# Altium schematic sheet SM619GEFDFST.SchDoc
size A1; Organization: Protel International P/L; DocumentNumber: 2; SheetNumber: 2; SheetTotal: 10; PageSetup: Record=PageOptions|CenterHorizontal=True|CenterVertical=True|PrintScale=0.70|XCorrection=1.00|YCorrection=1.00|PrintKind=2|BorderSize=5000000|LeftOffset=0|BottomOffset=0|Orientation=2|PaperLength=1000|PaperWidth=1000|Scale=100|PaperSource=7|PrintQuality=600|MediaType=1|DitherType=10|PaperKind=A4|PrintScaleMode=1; Razrabotal: Балобанов; Proveril: Шартдинов; NachKb: Рекалов; Nkontr: Завалина; Utv: Беккель; DecNum: ЦВИЯ.467239.035 Э3; Naim1: УУ; Naim2: Схема электрическая; Naim3: принципиальная; List: 1; Listov: 1; DecNum2: ЦВИЯ.467239.035 Э3
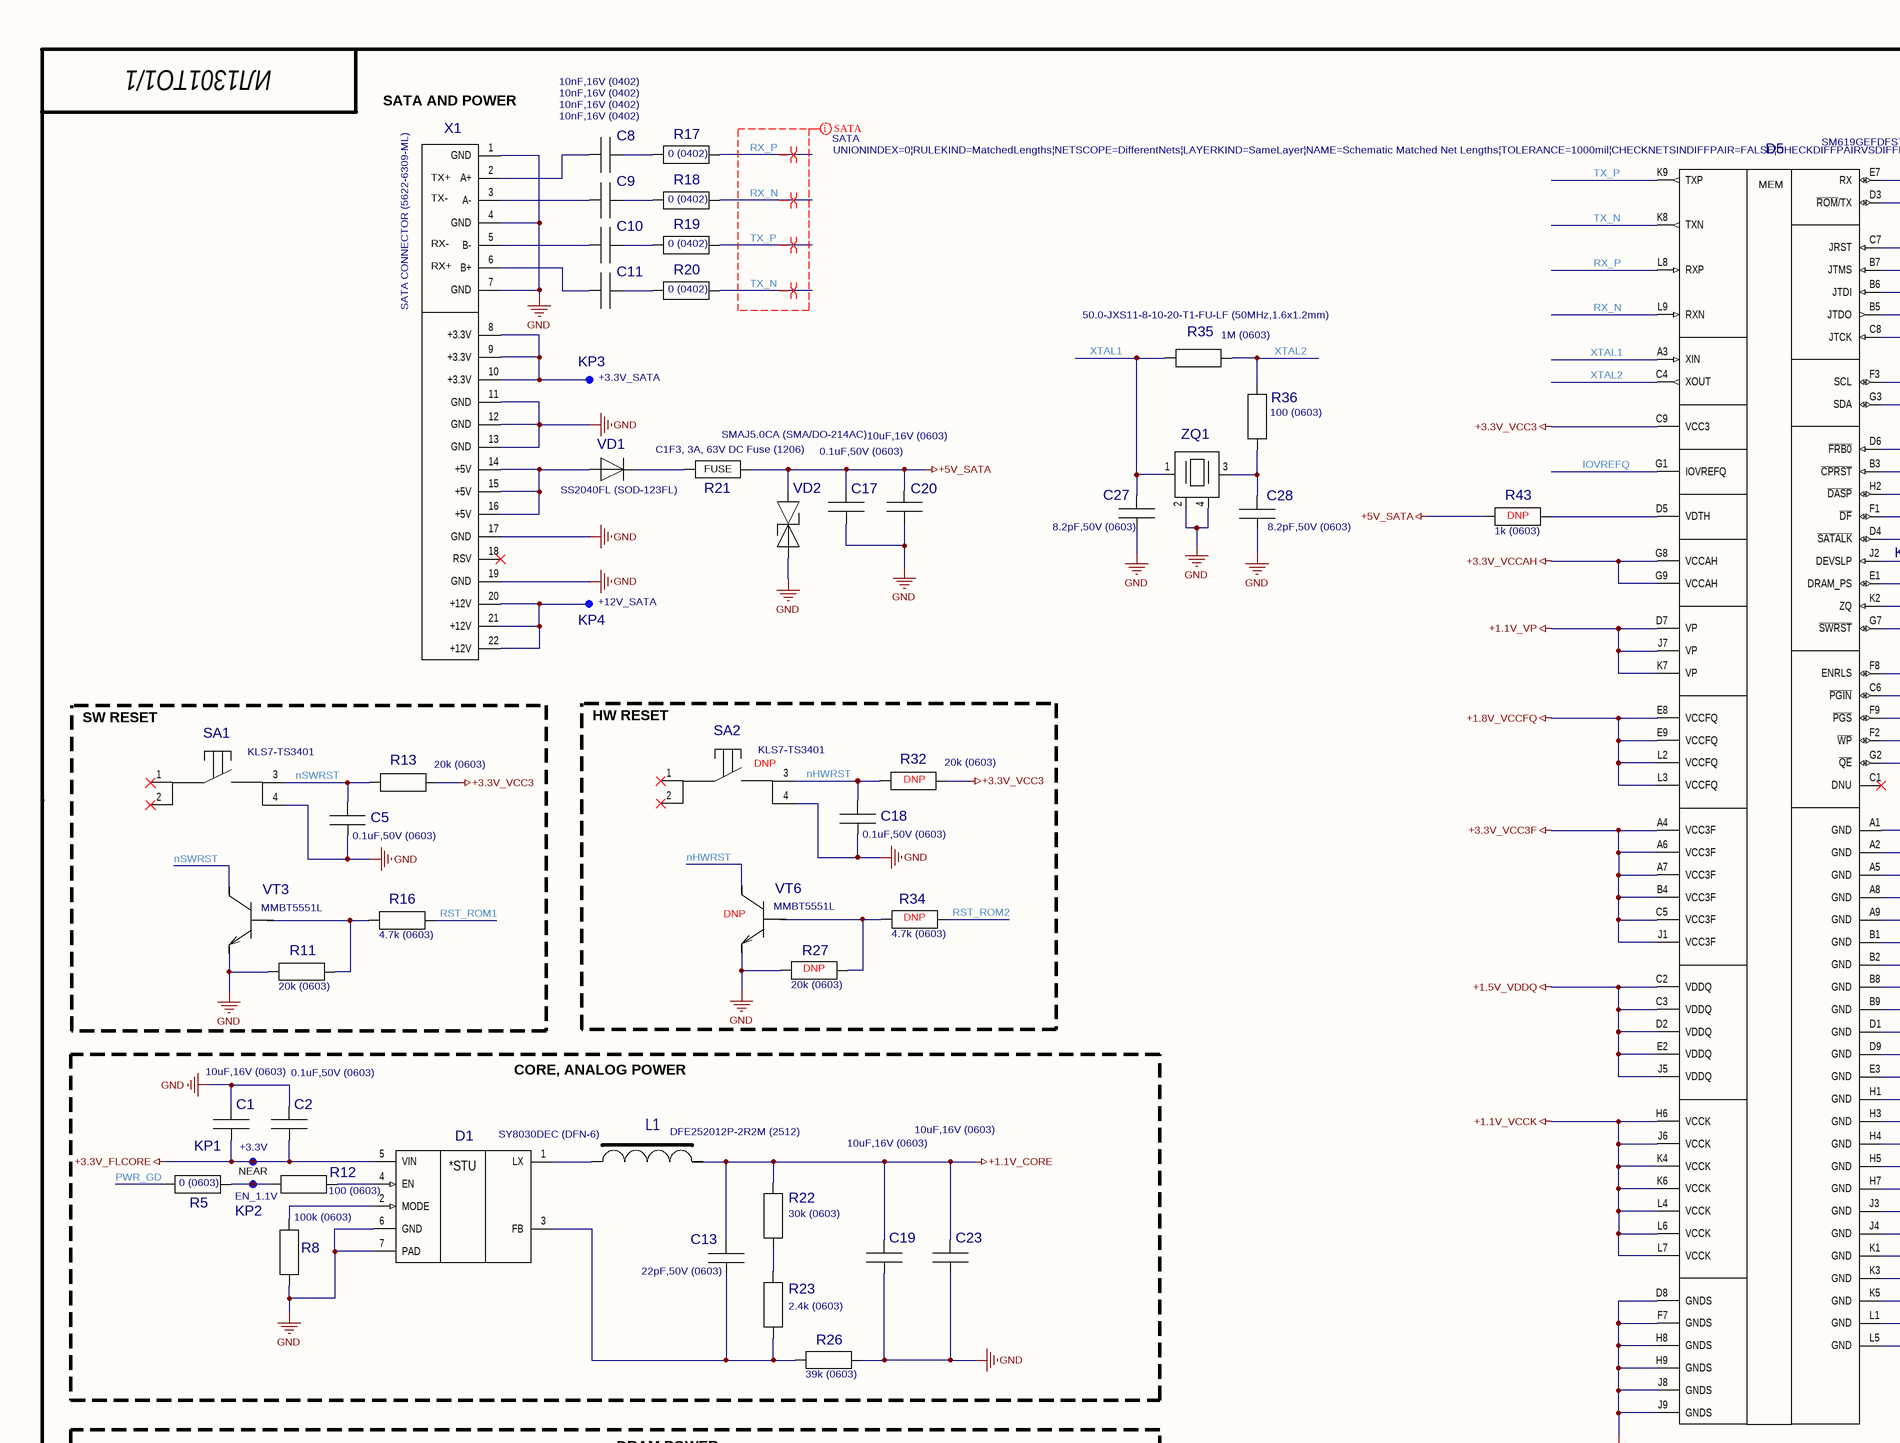
[diagram p0: SM619GEFDFST.SchDoc, top left]
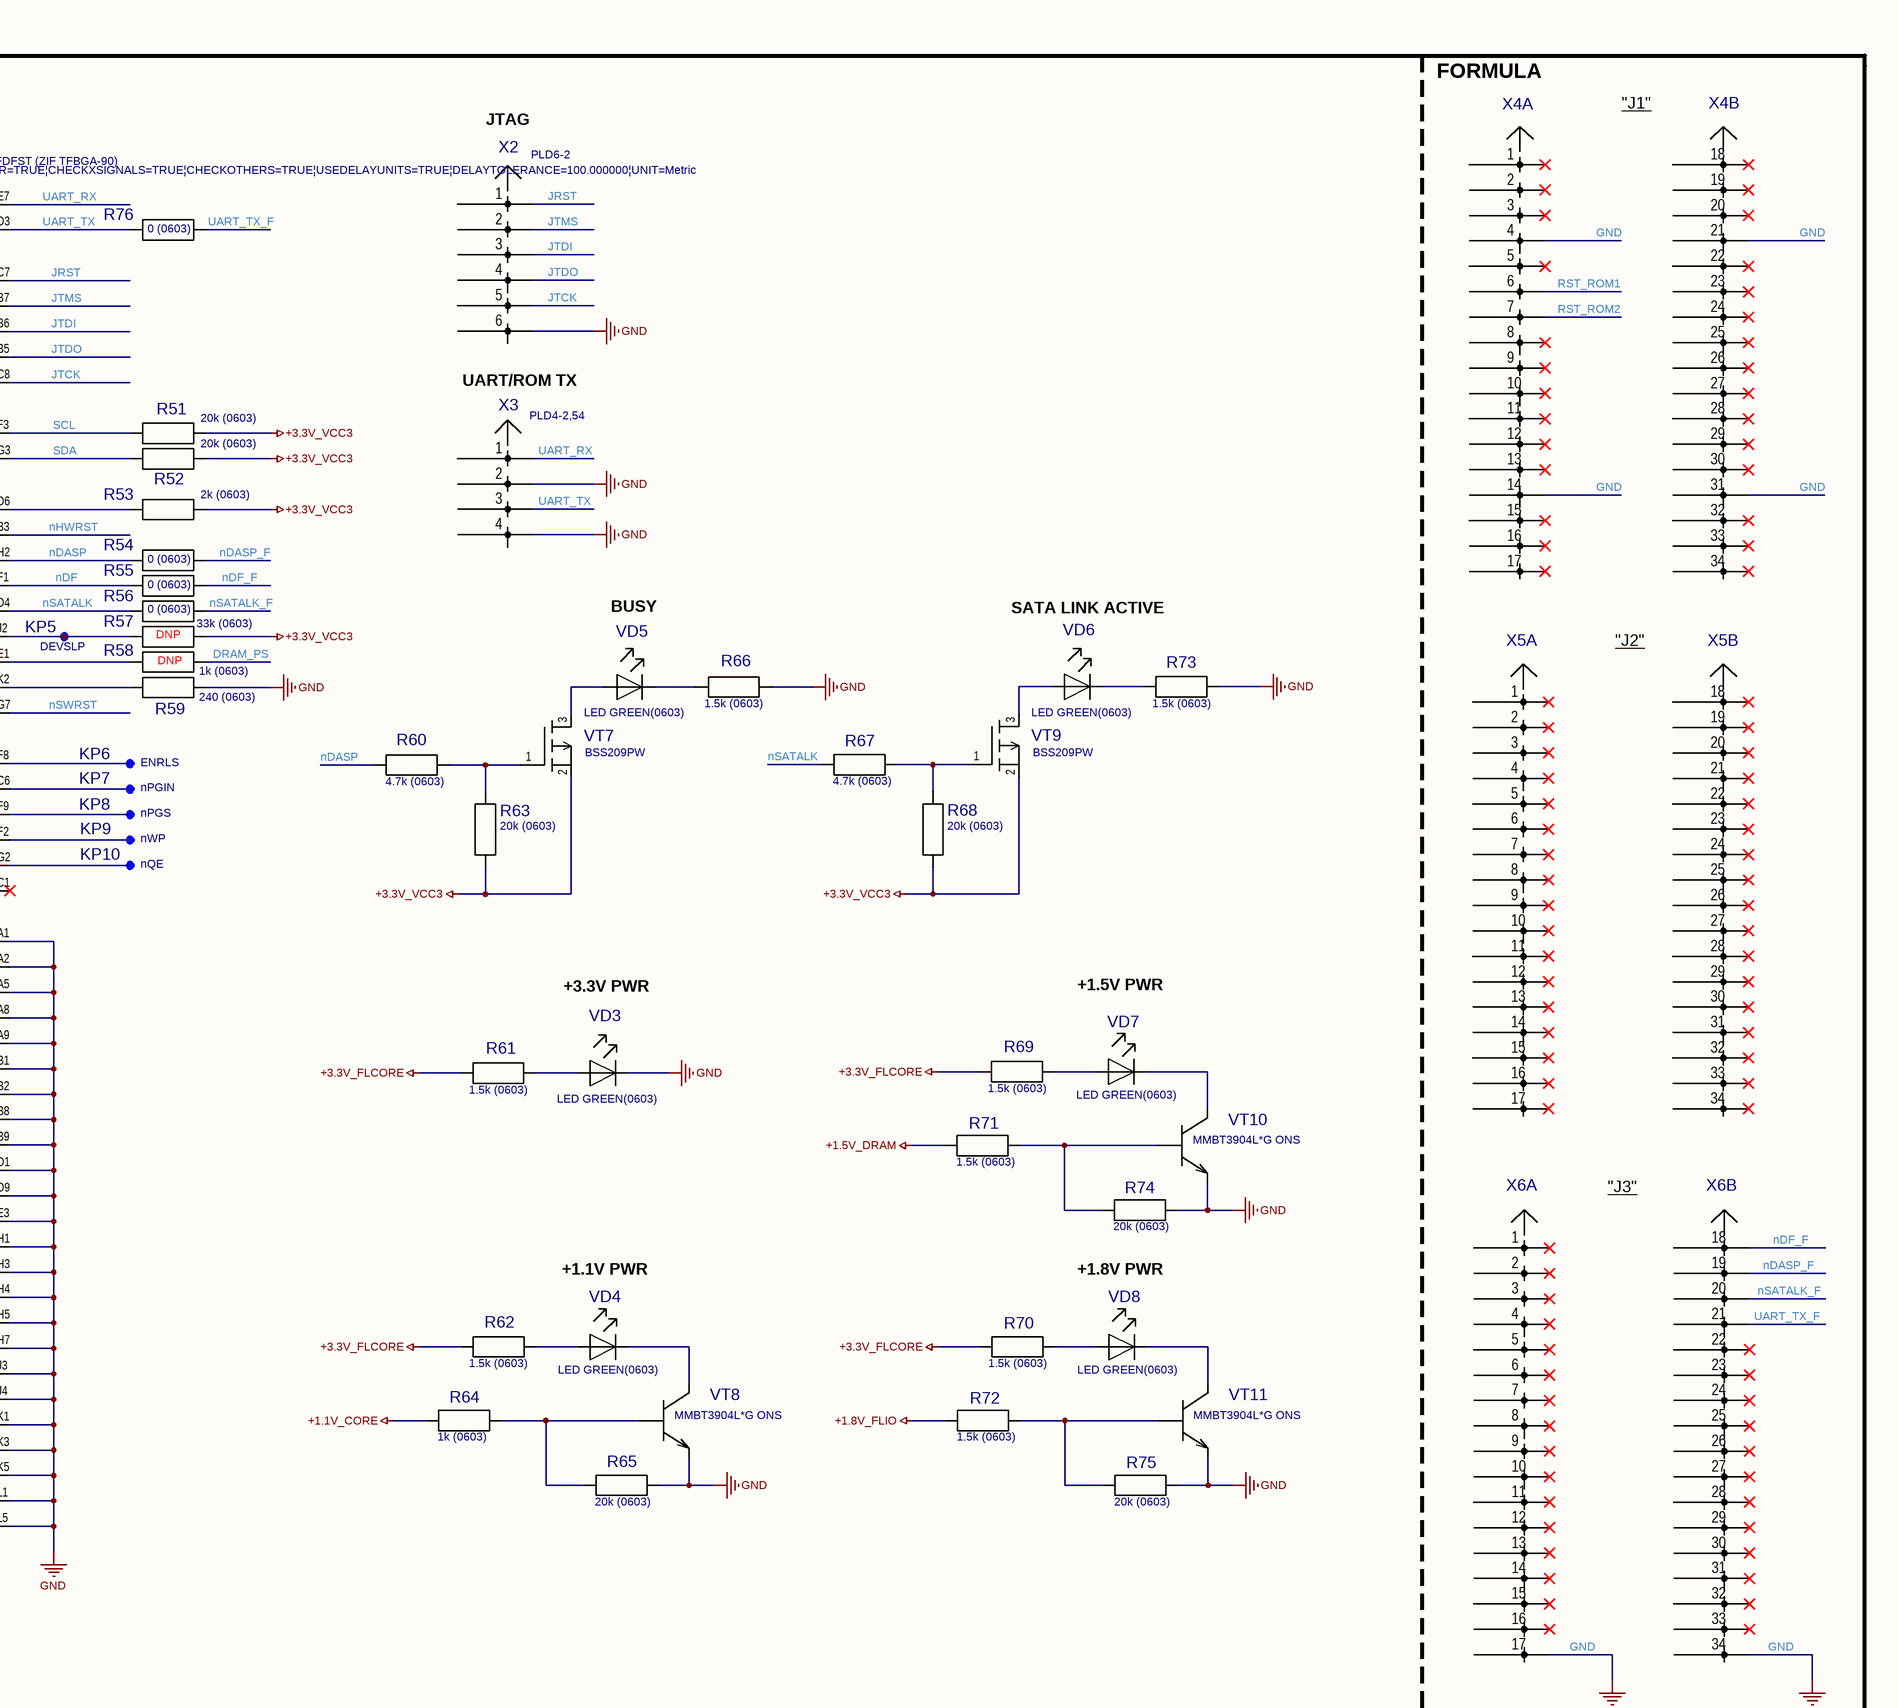
[diagram p1: SM619GEFDFST.SchDoc, top right]
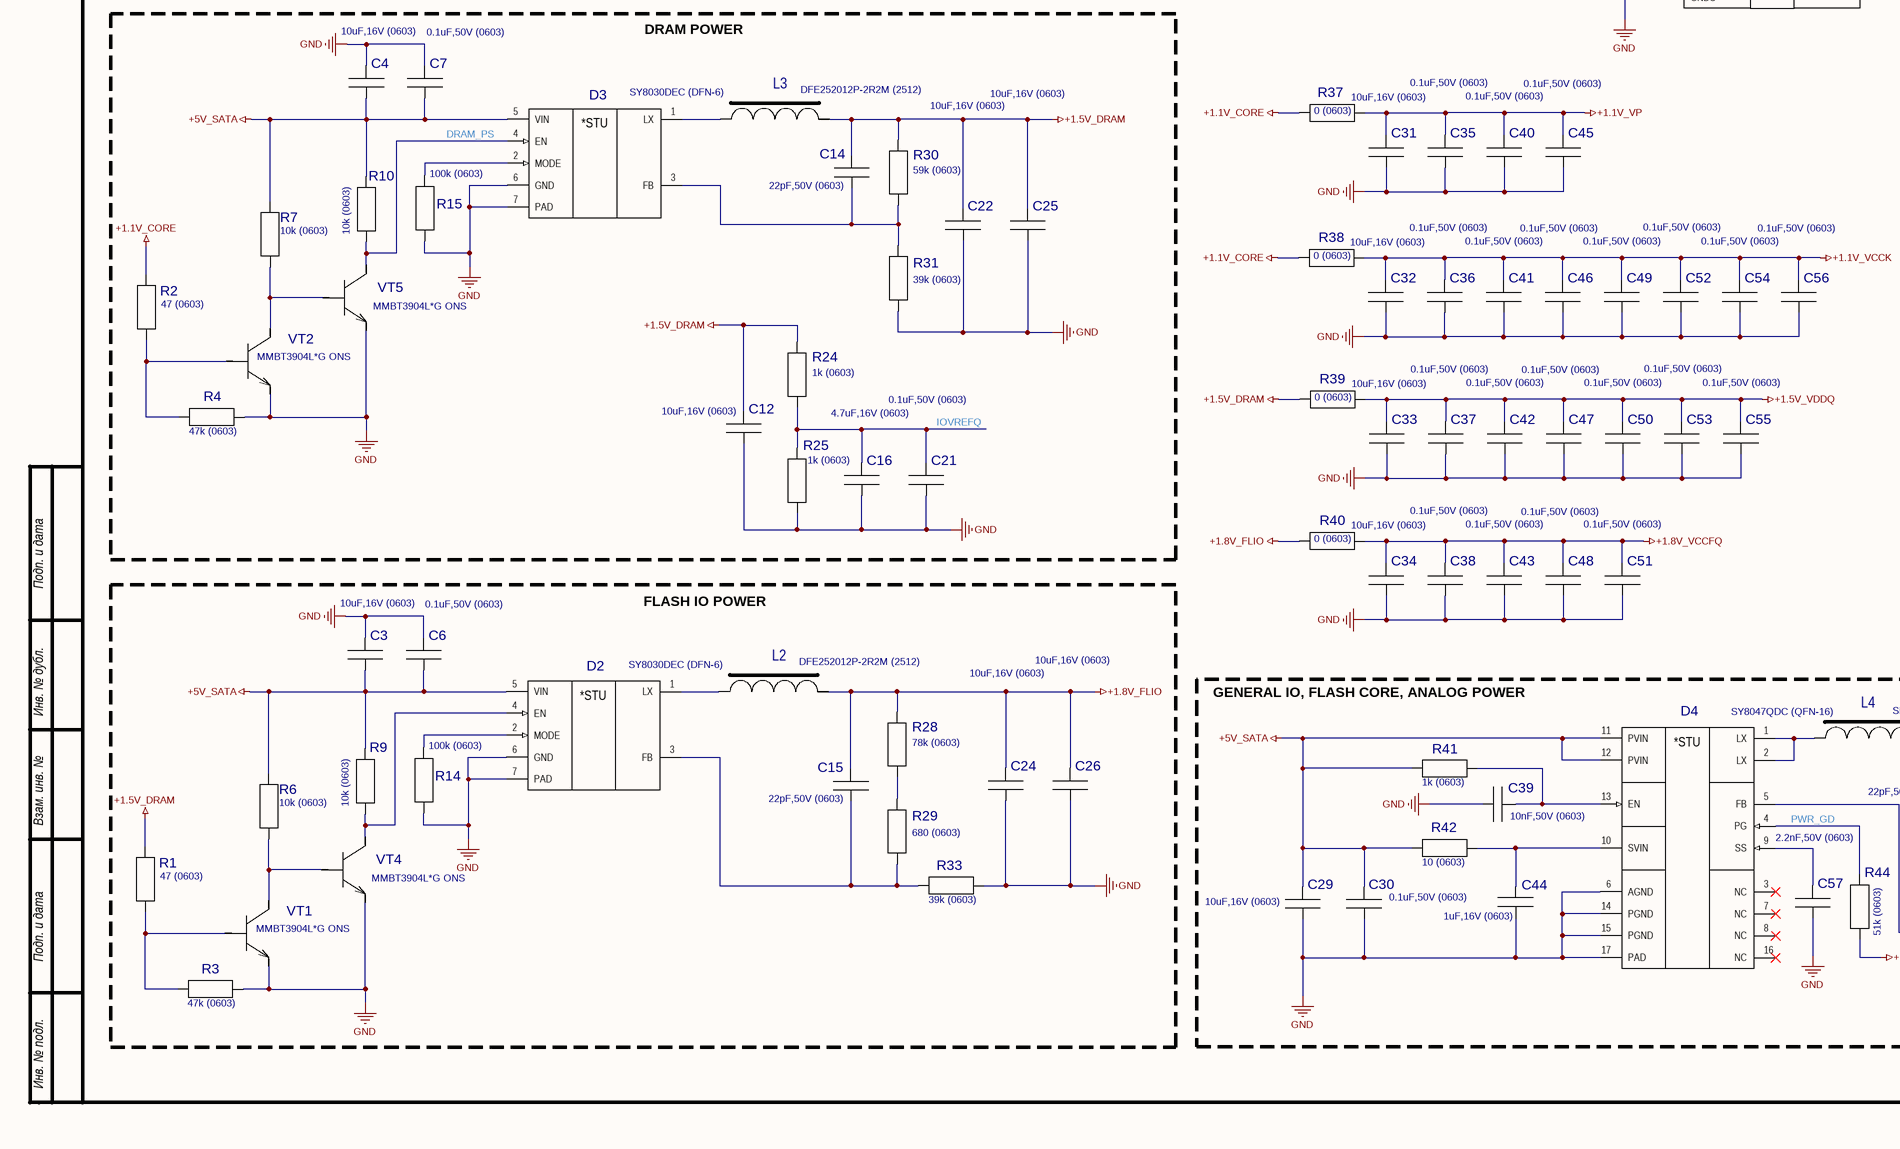
[diagram p2: SM619GEFDFST.SchDoc, bottom left]
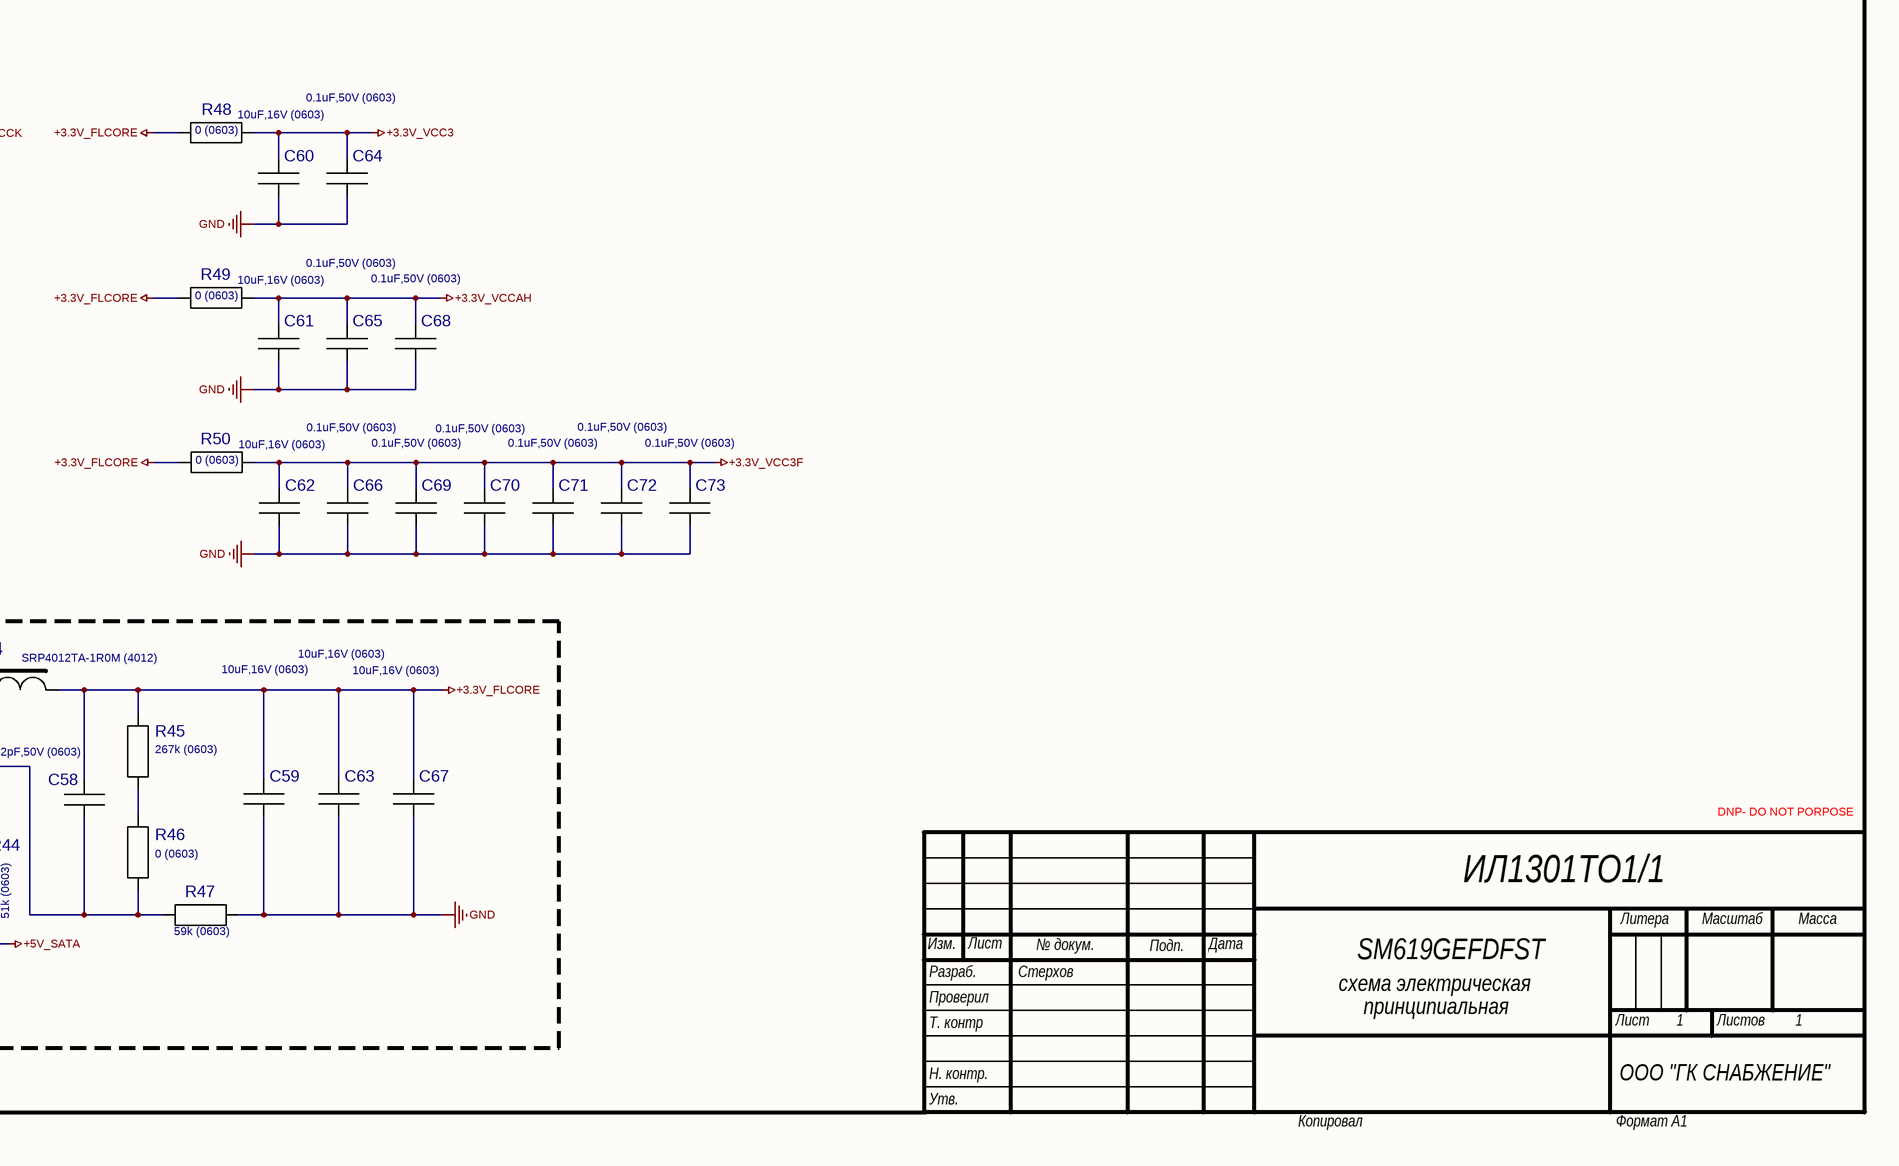
[diagram p3: SM619GEFDFST.SchDoc, bottom right]

## Parts
C1  10uF,16V (0603)  [0603]
C2  0.1uF,50V (0603)  [0603]
C3  10uF,16V (0603)  [0603]
C4  10uF,16V (0603)  [0603]
C5  0.1uF,50V (0603)  [0603]
C6  0.1uF,50V (0603)  [0603]
C7  0.1uF,50V (0603)  [0603]
C8  10nF,16V (0402)  [0402]
C9  10nF,16V (0402)  [0402]
C10  10nF,16V (0402)  [0402]
C11  10nF,16V (0402)  [0402]
C12  10uF,16V (0603)  [0603]
C13  22pF,50V (0603)  [0603]
C14  22pF,50V (0603)  [0603]
C15  22pF,50V (0603)  [0603]
C16  4.7uF,16V (0603)  [0603]
C17  0.1uF,50V (0603)  [0603]
C18  0.1uF,50V (0603)  [0603]
C19  10uF,16V (0603)  [0603]
C20  10uF,16V (0603)  [0603]
C21  0.1uF,50V (0603)  [0603]
C22  10uF,16V (0603)  [0603]
C23  10uF,16V (0603)  [0603]
C24  10uF,16V (0603)  [0603]
C25  10uF,16V (0603)  [0603]
C26  10uF,16V (0603)  [0603]
C27  8.2pF,50V (0603)  [0603]
C28  8.2pF,50V (0603)  [0603]
C29  10uF,16V (0603)  [0603]
C30  0.1uF,50V (0603)  [0603]
C31  10uF,16V (0603)  [0603]
C32  10uF,16V (0603)  [0603]
C33  10uF,16V (0603)  [0603]
C34  10uF,16V (0603)  [0603]
C35  0.1uF,50V (0603)  [0603]
C36  0.1uF,50V (0603)  [0603]
C37  0.1uF,50V (0603)  [0603]
C38  0.1uF,50V (0603)  [0603]
C39  10nF,50V (0603)  [0603]
C40  0.1uF,50V (0603)  [0603]
C41  0.1uF,50V (0603)  [0603]
C42  0.1uF,50V (0603)  [0603]
C43  0.1uF,50V (0603)  [0603]
C44  1uF,16V (0603)  [0603]
C45  0.1uF,50V (0603)  [0603]
C46  0.1uF,50V (0603)  [0603]
C47  0.1uF,50V (0603)  [0603]
C48  0.1uF,50V (0603)  [0603]
C49  0.1uF,50V (0603)  [0603]
C50  0.1uF,50V (0603)  [0603]
C51  0.1uF,50V (0603)  [0603]
C52  0.1uF,50V (0603)  [0603]
C53  0.1uF,50V (0603)  [0603]
C54  0.1uF,50V (0603)  [0603]
C55  0.1uF,50V (0603)  [0603]
C56  0.1uF,50V (0603)  [0603]
C57  2.2nF,50V (0603)  [0603]
C58  22pF,50V (0603)  [0603]
C59  10uF,16V (0603)  [0603]
C60  10uF,16V (0603)  [0603]
C61  10uF,16V (0603)  [0603]
C62  10uF,16V (0603)  [0603]
C63  10uF,16V (0603)  [0603]
C64  0.1uF,50V (0603)  [0603]
C65  0.1uF,50V (0603)  [0603]
C66  0.1uF,50V (0603)  [0603]
C67  10uF,16V (0603)  [0603]
C68  0.1uF,50V (0603)  [0603]
C69  0.1uF,50V (0603)  [0603]
C70  0.1uF,50V (0603)  [0603]
C71  0.1uF,50V (0603)  [0603]
C72  0.1uF,50V (0603)  [0603]
C73  0.1uF,50V (0603)  [0603]
D1  SY8030DEC (DFN-6)  [DFN-6(2x2)]
D2  SY8030DEC (DFN-6)  [DFN-6(2x2)]
D3  SY8030DEC (DFN-6)  [DFN-6(2x2)]
D4  SY8047QDC (QFN-16)  [QFN-16]
D5  SM619GEFDFST (ZIF TFBGA-90)  [ASS3145-BGA90-16X20-1-1.67-ZS]
KP1  +3.3V  [Plosh15X06]
KP2  EN_1.1V  [Plosh15X06]
KP3  +3.3V_SATA  [Plosh15X06]
KP4  +12V_SATA  [Plosh15X06]
KP5  DEVSLP  [Plosh15X06]
KP6  ENRLS  [Plosh15X06]
KP7  nPGIN  [Plosh15X06]
KP8  nPGS  [Plosh15X06]
KP9  nWP  [Plosh15X06]
KP10  nQE  [Plosh15X06]
L1  DFE252012P-2R2M (2512)  [DFE252012P-2R2M (2512)]
L2  DFE252012P-2R2M (2512)  [DFE252012P-2R2M (2512)]
L3  DFE252012P-2R2M (2512)  [DFE252012P-2R2M (2512)]
L4  SRP4012TA-1R0M (4012)  [SRP4012TA-1R0M (4012)]
R1  47 (0603)  [0603]
R2  47 (0603)  [0603]
R3  47k (0603)  [0603]
R4  47k (0603)  [0603]
R5  0 (0603)  [0603]
R6  10k (0603)  [0603]
R7  10k (0603)  [0603]
R8  100k (0603)  [0603]
R9  10k (0603)  [0603]
R10  10k (0603)  [0603]
R11  20k (0603)  [0603]
R12  100 (0603)  [0603]
R13  20k (0603)  [0603]
R14  100k (0603)  [0603]
R15  100k (0603)  [0603]
R16  4.7k (0603)  [0603]
R17  0 (0402)  [0402]
R18  0 (0402)  [0402]
R19  0 (0402)  [0402]
R20  0 (0402)  [0402]
R21  C1F3, 3A, 63V DC Fuse (1206)  [1206]
R22  30k (0603)  [0603]
R23  2.4k (0603)  [0603]
R24  1k (0603)  [0603]
R25  1k (0603)  [0603]
R26  39k (0603)  [0603]
R27  20k (0603)  [0603]
R28  78k (0603)  [0603]
R29  680 (0603)  [0603]
R30  59k (0603)  [0603]
R31  39k (0603)  [0603]
R32  20k (0603)  [0603]
R33  39k (0603)  [0603]
R34  4.7k (0603)  [0603]
R35  1M (0603)  [0603]
R36  100 (0603)  [0603]
R37  0 (0603)  [0603]
R38  0 (0603)  [0603]
R39  0 (0603)  [0603]
R40  0 (0603)  [0603]
R41  1k (0603)  [0603]
R42  10 (0603)  [0603]
R43  1k (0603)  [0603]
R44  51k (0603)  [0603]
R45  267k (0603)  [0603]
R46  0 (0603)  [0603]
R47  59k (0603)  [0603]
R48  0 (0603)  [0603]
R49  0 (0603)  [0603]
R50  0 (0603)  [0603]
R51  20k (0603)  [0603]
R52  20k (0603)  [0603]
R53  2k (0603)  [0603]
R54  0 (0603)  [0603]
R55  0 (0603)  [0603]
R56  0 (0603)  [0603]
R57  33k (0603)  [0603]
R58  1k (0603)  [0603]
R59  240 (0603)  [0603]
R60  4.7k (0603)  [0603]
R61  1.5k (0603)  [0603]
R62  1.5k (0603)  [0603]
R63  20k (0603)  [0603]
R64  1k (0603)  [0603]
R65  20k (0603)  [0603]
R66  1.5k (0603)  [0603]
R67  4.7k (0603)  [0603]
R68  20k (0603)  [0603]
R69  1.5k (0603)  [0603]
R70  1.5k (0603)  [0603]
R71  1.5k (0603)  [0603]
R72  1.5k (0603)  [0603]
R73  1.5k (0603)  [0603]
R74  20k (0603)  [0603]
R75  20k (0603)  [0603]
R76  0 (0603)  [0603]
SA1  KLS7-TS3401  [KLS7-TS3401]
SA2  KLS7-TS3401  [KLS7-TS3401]
VD1  SS2040FL (SOD-123FL)  [SOD-123]
VD2  SMAJ5.0CA (SMA/DO-214AC)  [SMA(DO-214AC)]
VD3  LED GREEN(0603)  [0603(LED)]
VD4  LED GREEN(0603)  [0603(LED)]
VD5  LED GREEN(0603)  [0603(LED)]
VD6  LED GREEN(0603)  [0603(LED)]
VD7  LED GREEN(0603)  [0603(LED)]
VD8  LED GREEN(0603)  [0603(LED)]
VT1  MMBT3904L*G ONS  [SOT-23]
VT2  MMBT3904L*G ONS  [SOT-23]
VT3  MMBT5551L  [SOT-23]
VT4  MMBT3904L*G ONS  [SOT-23]
VT5  MMBT3904L*G ONS  [SOT-23]
VT6  MMBT5551L  [SOT-23]
VT7  BSS209PW  [SOT-323]
VT8  MMBT3904L*G ONS  [SOT-23]
VT9  BSS209PW  [SOT-323]
VT10  MMBT3904L*G ONS  [SOT-23]
VT11  MMBT3904L*G ONS  [SOT-23]
X1  SATA CONNECTOR (5622-6309-ML)  [SATA CONNECTOR]
X2  PLD6-2  [PLD6-2]
X3  PLD4-2,54  [PLD4-2,54]
X4  PBS34-2,54  [PBS34-2,54]  (value not drawn)  (parts A,B of 2)
X5  PBS34-2,54  [PBS34-2,54]  (value not drawn)  (parts A,B of 2)
X6  PBS34-2,54  [PBS34-2,54]  (value not drawn)  (parts A,B of 2)
ZQ1  50.0-JXS11-8-10-20-T1-FU-LF (50MHz,1.6x1.2mm)  [50.0-JXS11-8-10-20-T1-FU-LF (50MHz,1.6x1.2mm)]

## Blocks framed on the sheet
SW RESET: C5 R11 R13 R16 SA1 VT3
HW RESET: C18 R27 R32 R34 SA2 VT6
CORE, ANALOG POWER: C1 C2 C13 C19 C23 D1 KP1 KP2 L1 R5 R8 R12 R22 R23 R26
DRAM POWER: C4 C7 C12 C14 C16 C21 C22 C25 D3 L3 R2 R4 R7 R10 R15 R24 R25 R30 R31 VT2 VT5
FLASH IO POWER: C3 C6 C15 C24 C26 D2 L2 R1 R3 R6 R9 R14 R28 R29 R33 VT1 VT4
GENERAL IO, FLASH CORE, ANALOG POWER: C29 C30 C39 C44 C57-C59 C63 C67 D4 L4 R41 R42 R44-R47

## Nets
+1.1V_CORE: C13.1 C19.1 C23.1 L1.2 R2.2 R22.2 R37.1 R38.1 R64.2
+1.1V_VCCK: C32.1 C36.1 C41.1 C46.1 C49.1 C52.1 C54.1 C56.1 D5.H6(VCCK) D5.J6(VCCK) D5.K4(VCCK) D5.K6(VCCK) D5.L4(VCCK) D5.L6(VCCK) D5.L7(VCCK) R38.2
+1.1V_VP: C31.1 C35.1 C40.1 C45.1 D5.D7(VP) D5.J7(VP) D5.K7(VP) R37.2
+1.5V_DRAM: C12.1 C14.1 C22.1 C25.1 L3.2 R1.2 R24.2 R30.2 R39.1 R71.2
+1.5V_VDDQ: C33.1 C37.1 C42.1 C47.1 C50.1 C53.1 C55.1 D5.C2(VDDQ) D5.C3(VDDQ) D5.D2(VDDQ) D5.E2(VDDQ) D5.J5(VDDQ) R39.2
+1.8V_FLIO: C15.1 C24.1 C26.1 L2.2 R28.2 R40.1 R72.2
+1.8V_VCCFQ: C34.1 C38.1 C43.1 C48.1 C51.1 D5.E8(VCCFQ) D5.E9(VCCFQ) D5.L2(VCCFQ) D5.L3(VCCFQ) R40.2
+3.3V_FLCORE: C1.2 C2.2 C58.1 C59.1 C63.1 C67.1 D1.5(VIN) KP1.1 L4.2 R45.2 R48.1 R49.1 R50.1 R61.1 R62.1 R69.1 R70.1
+3.3V_VCC3: C60.1 C64.1 D5.C9(VCC3) R13.2 R32.2 R48.2 R51.1 R52.1 R53.1 R57.1 R63.2 R68.2 VT7.2(S) VT9.2(S)
+3.3V_VCC3F: C62.1 C66.1 C69.1 C70.1 C71.1 C72.1 C73.1 D5.A4(VCC3F) D5.A6(VCC3F) D5.A7(VCC3F) D5.B4(VCC3F) D5.C5(VCC3F) D5.J1(VCC3F) R50.2
+3.3V_VCCAH: C61.1 C65.1 C68.1 D5.G8(VCCAH) D5.G9(VCCAH) R49.2
+5V_SATA: C3.2 C4.2 C6.2 C7.2 C17.2 C20.2 C29.1 C30.1 D2.5(VIN) D3.5(VIN) D4.11(PVIN) D4.12(PVIN) R6.2 R7.2 R9.2 R10.2 R21.2 R41.2 R42.2 R43.2 R44.1 VD2.2(K)
GND: C1.1 C2.1 C3.1 C4.1 C5.2 C6.1 C7.1 C12.2 C16.2 C17.1 C18.2 C19.2 C20.1 C21.2 C22.2 C23.2 C24.2 C25.2 C26.2 C27.2 C28.2 C29.2 C30.2 C31.2 C32.2 C33.2 C34.2 C35.2 C36.2 C37.2 C38.2 C39.2 C40.2 C41.2 C42.2 C43.2 C44.1 C45.2 C46.2 C47.2 C48.2 C49.2 C50.2 C51.2 C52.2 C53.2 C54.2 C55.2 C56.2 C57.2 C59.2 C60.2 C61.2 C62.2 C63.2 C64.2 C65.2 C66.2 C67.2 C68.2 C69.2 C70.2 C71.2 C72.2 C73.2 D1.6(GND) D1.7(PAD) D2.6(GND) D2.7(PAD) D3.6(GND) D3.7(PAD) D4.6(AGND) D4.14(PGND) D4.15(PGND) D4.17(PAD) D5.A1(GND) D5.A2(GND) D5.A5(GND) D5.A8(GND) D5.A9(GND) D5.B1(GND) D5.B2(GND) D5.B8(GND) D5.B9(GND) D5.D1(GND) D5.D8(GNDS) D5.D9(GND) D5.E3(GND) D5.F7(GNDS) D5.H1(GND) D5.H3(GND) D5.H4(GND) D5.H5(GND) D5.H7(GND) D5.H8(GNDS) D5.H9(GNDS) D5.J3(GND) D5.J4(GND) D5.J8(GNDS) D5.J9(GNDS) D5.K1(GND) D5.K3(GND) D5.K5(GND) D5.L1(GND) D5.L5(GND) R3.1 R4.1 R8.1 R11.2 R14.1 R15.1 R25.1 R26.2 R27.2 R31.1 R33.2 R47.2 R59.1 R65.1 R66.2 R73.2 R74.1 R75.1 SA1.4 SA2.4 VD2.1(A) VD3.2(K) VT1.2(E) VT2.2(E) VT3.2(E) VT4.2(E) VT5.2(E) VT6.2(E) VT8.2(E) VT10.2(E) VT11.2(E) X1.1(GND) X1.4(GND) X1.7(GND) X1.11(GND) X1.12(GND) X1.13(GND) X1.17(GND) X1.19(GND) X2.6 X3.2 X3.4 X4.4 X4.14 X4.21 X4.31 X6.17 X6.34 ZQ1.2 ZQ1.4
DRAM_PS: D3.4(EN) R10.1 R58.1 VT5.3(K)
IOVREFQ: C16.1 C21.1 D5.G1(IOVREFQ) R24.1 R25.2
JRST: D5.C7(JRST) X2.1
JTCK: D5.C8(JTCK) X2.5
JTDI: D5.B6(JTDI) X2.3
JTDO: D5.B5(JTDO) X2.4
JTMS: D5.B7(JTMS) X2.2
nDASP: D5.H2(~{DASP}) R54.2 R60.2
nDASP_F: R54.1 X6.19
nDF: D5.F1(~{DF}) R55.2
nDF_F: R55.1 X6.18
nHWRST: C18.1 D5.B3(~{CPRST}) R32.1 SA2.3 VT6.3(K)
nSATALK: D5.D4(~{SATALK}) R56.2 R67.2
nSATALK_F: R56.1 X6.20
nSWRST: C5.1 D5.G7(~{SWRST}) R13.1 SA1.3 VT3.3(K)
PWR_GD: D4.4(PG) R5.2 R44.2
RST_ROM1: R16.1 X4.6
RST_ROM2: R34.1 X4.7
RX_N: D5.L9(RXN) R18.2
RX_P: D5.L8(RXP) R17.2
SCL: D5.F3(SCL) R51.2
SDA: D5.G3(SDA) R52.2
TX_N: D5.K8(TXN) R20.2
TX_P: D5.K9(TXP) R19.2
UART_RX: D5.E7(RX) X3.1
UART_TX: D5.D3(~{ROM}/TX) R76.2 X3.3
UART_TX_F: R76.1 X6.21
XTAL1: C27.1 D5.A3(XIN) R35.1 ZQ1.1
XTAL2: D5.C4(XOUT) R35.2 R36.2
NetC8_1: C8.1 R17.1
NetC8_2: C8.2 X1.2(A+)
NetC9_1: C9.1 R18.1
NetC9_2: C9.2 X1.3(A-)
NetC10_1: C10.1 R19.1
NetC10_2: C10.2 X1.5(B-)
NetC11_1: C11.1 R20.1
NetC11_2: C11.2 X1.6(B+)
NetC13_2: C13.2 D1.3(FB) R23.1 R26.1
NetC14_2: C14.2 D3.3(FB) R30.1 R31.2
NetC15_2: C15.2 D2.3(FB) R29.1 R33.1
NetC28_1: C28.1 R36.1 ZQ1.3
NetC39_1: C39.1 D4.13(EN) R41.1
NetC44_2: C44.2 D4.10(SVIN) R42.1
NetC57_1: C57.1 D4.9(SS)
NetC58_2: C58.2 D4.5(FB) R46.1 R47.1
NetD1_1: D1.1(LX) L1.1
NetD1_2: D1.2(MODE) R8.2
NetD1_4: D1.4(EN) R12.1
NetD2_1: D2.1(LX) L2.1
NetD2_2: D2.2(MODE) R14.2
NetD2_4: D2.4(EN) R9.1 VT4.3(K)
NetD3_1: D3.1(LX) L3.1
NetD3_2: D3.2(MODE) R15.2
NetD4_1: D4.1(LX) D4.2(LX) L4.1
NetD5_C6: D5.C6(~{PGIN}) KP7.1
NetD5_D5: D5.D5(VDTH) R43.1
NetD5_D6: D5.D6(~{FRB0}) R53.2
NetD5_E1: D5.E1(DRAM_PS) R58.2
NetD5_F2: D5.F2(~{WP}) KP9.1
NetD5_F8: D5.F8(ENRLS) KP6.1
NetD5_F9: D5.F9(~{PGS}) KP8.1
NetD5_G2: D5.G2(~{QE}) KP10.1
NetD5_J2: D5.J2(DEVSLP) KP5.1 R57.2
NetD5_K2: D5.K2(ZQ) R59.2
NetKP2_1: KP2.1 R5.1 R12.2
NetKP3_1: KP3.1 X1.8(+3.3V) X1.9(+3.3V) X1.10(+3.3V)
NetKP4_1: KP4.1 X1.20(+12V) X1.21(+12V) X1.22(+12V)
NetR1_1: R1.1 R3.2 VT1.1(B)
NetR2_1: R2.1 R4.2 VT2.1(B)
NetR6_1: R6.1 VT1.3(K) VT4.1(B)
NetR7_1: R7.1 VT2.3(K) VT5.1(B)
NetR11_1: R11.1 R16.2 VT3.1(B)
NetR21_1: R21.1 VD1.2(K)
NetR22_1: R22.1 R23.2
NetR27_1: R27.1 R34.2 VT6.1(B)
NetR28_1: R28.1 R29.2
NetR45_1: R45.1 R46.2
NetR60_1: R60.1 R63.1 VT7.1(G)
NetR61_2: R61.2 VD3.1(A)
NetR62_2: R62.2 VD4.1(A)
NetR64_1: R64.1 R65.2 VT8.1(B)
NetR66_1: R66.1 VD5.2(K)
NetR67_1: R67.1 R68.1 VT9.1(G)
NetR69_2: R69.2 VD7.1(A)
NetR70_2: R70.2 VD8.1(A)
NetR71_1: R71.1 R74.2 VT10.1(B)
NetR72_1: R72.1 R75.2 VT11.1(B)
NetR73_1: R73.1 VD6.2(K)
NetVD1_1: VD1.1(A) X1.14(+5V) X1.15(+5V) X1.16(+5V)
NetVD4_2: VD4.2(K) VT8.3(K)
NetVD5_1: VD5.1(A) VT7.3(D)
NetVD6_1: VD6.1(A) VT9.3(D)
NetVD7_2: VD7.2(K) VT10.3(K)
NetVD8_2: VD8.2(K) VT11.3(K)

Not connected (* = marked no-connect by the designer): D4 3(NC)* 7(NC)* 8(NC)* 16(NC)*; D5 C1(DNU)*; SA1 1* 2*; SA2 1* 2*; X1 18(RSV)*; X4 1* 2* 3* 5* 8* 9* 10* 11* 12* 13* 15* 16* 17* 18* 19* 20* 22* 23* 24* 25* 26* 27* 28* 29* 30* 32* 33* 34*; X5 1* 2* 3* 4* 5* 6* 7* 8* 9* 10* 11* 12* 13* 14* 15* 16* 17* 18* 19* 20* 21* 22* 23* 24* 25* 26* 27* 28* 29* 30* 31* 32* 33* 34*; X6 1* 2* 3* 4* 5* 6* 7* 8* 9* 10* 11* 12* 13* 14* 15* 16* 22* 23* 24* 25* 26* 27* 28* 29* 30* 31* 32* 33*

## Layout directives
differential pair: RX_N, RX_P, TX_N, TX_P
net class SATA; rule Matched Net Lengths [Delay Tolerance = 100ps]: RX_N, RX_P, TX_N, TX_P

## Notes on the sheet
- ИЛ1301ТО1/1
- FORMULA
- (near X1) SATA AND POWER
- JTAG
- "J1"
- (near X1) TX+
- (near X1) TX-
- (near X1) RX-
- (near X1) RX+
- (near X2) UART/ROM TX
- (near R21) FUSE
- (near R43) DNP
- BUSY
- (near R57) DNP
- (near R58) DNP
- SATA LINK ACTIVE
- "J2"
- (near SA2) DNP
- (near R32) DNP
- +3.3V PWR
- +1.5V PWR
- (near VT6) DNP
- (near R34) DNP
- (near R27) DNP
- "J3"
- +1.1V PWR
- +1.8V PWR
- NEAR
- Подп. и дата
- Инв. № дубл.
- Взам. инв. №
- DNP- DO NOT PORPOSE
- Изм.
- Лист
- № докум.
- Подп.
- Дата
- SM619GEFDFST
- Литера
- Масштаб
- Масса
- Разраб.
- Проверил
- Т. контр
- Стерхов
- схема электрическая
- принципиальная
- 1
- Листов
- Инв. № подл.
- Н. контр.
- ООО "ГК СНАБЖЕНИЕ"
- Утв.
- Копировал
- Формат А1
- (in symbol SM619GEFDFST (ZIF TFBGA-90)) MEM
- (in symbol SY8030DEC (DFN-6)) *STU
- (in symbol SY8047QDC (QFN-16)) *STU

## Library data of the parts
C1-C7 C12-C73 = Cap (0603) AVX: ComponentHeigt: 1.3; Firme: AVX; Leadform: SMD; KIND: Конденсатор; ClassName: *; Component Link: *; ComponentWeigt: *; Packaging: 0805; NN: *; Value: *
C8-C11 = Cap (0402) AVX: ComponentHeigt: 1.3; Firme: AVX; Leadform: SMD; KIND: Конденсатор; ClassName: *; Component Link: *; ComponentWeigt: *; Packaging: 0805; NN: *; Value: *
D1-D3 = SY8030DEC (DFN-6): ComponentHeigt: 1.8; Firme: Linear; Leadform: формована; Kind: Микросхема; ClassName: *; Component Link: *; Packaging: SOT-223; NN: *
D4 = SY8047QDC (QFN-16): ComponentHeigt: 1.8; Firme: Linear; Leadform: формована; Kind: Микросхема; ClassName: *; Component Link: *; Packaging: SOT-223; NN: *
D5 = SM619GEFDFST (ZIF TFBGA-90): ComponentHeigt: 1.8; Firme: Linear; Leadform: формована; Kind: Микросхема; ClassName: *; Component Link: *; Packaging: SOT-223; NN: *
KP1-KP10 = Contplosh1.5x0.6: ClassName: *
L1-L3 = DFE252012P-2R2M (2512): Value: {Value}; ComponentHeigt: 3.2; Firm: TDK; Name: Катушка индуктивности; Kind: Катушка индуктивности B82432T TDK; Typ: B82432T; NN: *; Packaging: SIMIT 1812-T
L4 = SRP4012TA-1R0M (4012): Value: {Value}; ComponentHeigt: 3.2; Firm: TDK; Name: Катушка индуктивности; Kind: Катушка индуктивности B82432T TDK; Typ: B82432T; NN: *; Packaging: SIMIT 1812-T
R1-R16 R22-R76 = RC0603 Yageo: ComponentHeigt: 0.5; Leadform: SMD; Firme: Yageo; Kind: Резистор; Packaging: 0402; ClassName: *; Component Link: *; NN: *
R17-R20 = RC0402 Yageo: ComponentHeigt: 0.5; Leadform: SMD; Firme: Yageo; Kind: Резистор; Packaging: 0402; ClassName: *; Component Link: *; NN: *
R21 = RC1206 Yageo: ComponentHeigt: 0.6; Firme: Yageo; Leadform: SMD; Kind: Резистор; ClassName: *; ComponentWeigt: *; Component Link: *; Packaging: 0805; NN: *; Value: *
SA1 SA2 = KLS7-TS3401: Component Heigt: 7; Leadform: SMD; Firme: TYCO; NN: 25100175; KIND: Кнопка 1-1977223-9 Tyco; ClassName: *; Component Link: *
VD1 = SS2040FL (SOD-123FL): ComponentHeigt: 0.75; Leadform: в отверстия; Firme: Kingbright; NN: 24003000; KIND: Светодиод L-1154GD Kingbright; Component Link: *; ClassName: *
VD2 = SMAJ5.0CA (SMA/DO-214AC): ComponentHeigt: 0.75; Leadform: в отверстия; Firme: Kingbright; NN: 24003000; KIND: Светодиод L-1154GD Kingbright; Component Link: *; ClassName: *
VD3-VD8 = LED(0603): ComponentHeigt: 0.75; Leadform: в отверстия; Firme: Kingbright; NN: 24003000; KIND: Светодиод L-1154GD Kingbright; Component Link: *; ClassName: *
VT1 VT2 VT4 VT5 VT8 VT10 VT11 = MMBT3904L*G ONS: ComponentHeigt: 1.1; Leadform: SMD; NN: 24006226; KIND: Транзистор MMBT3904L*G ONS; ClassName: *; ComponentWeigt: *; Firme: ONS; Packaging: SOT-23
VT3 VT6 = MMBT5551L: ComponentHeigt: 1.1; Firme: ONS; Leadform: SMD; NN: 24007468; KIND: Транзистор MMBT5551L*G ONS; ClassName: *; ComponentWeigt: *; Packaging: SOT-23
VT7 VT9 = BSS209PW: ComponentHeigt: 0.9; Firme: Infineon; Leadform: SMD; NN: 24003422; KIND: Транзистор BSS209PW Infineon; ClassName: *; ComponentWeigt: *; Packaging: PG-SOT-323
X1 = SATA CONNECTOR (5622-6309-ML): ComponentHeigt: 5.5; Name: Вилка; Specification: Вилка PLD2-2 *; Typ: PLD2-2; ClassName: *; Component Link: *; ComponentWeigt: *; Firme: *; Leadform: *; NN: *; KIND: *
X2 = PLD6-2: ComponentHeigt: 5.5; Name: Вилка; Specification: Вилка PLD2-2 *; Typ: PLD2-2; ClassName: *; Component Link: *; ComponentWeigt: *; Firme: *; Leadform: *; NN: *; KIND: *
X3 = PLD4-2,54: ComponentHeigt: 5.5; Name: Вилка; Specification: Вилка PLD2-2 *; Typ: PLD2-2; ClassName: *; Component Link: *; ComponentWeigt: *; Firme: *; Leadform: *; NN: *; KIND: *
X4-X6 = PBS34-2,54: ComponentHeigt: 5.5; Name: Вилка; Specification: Вилка PLD2-2 *; Typ: PLD2-2; ClassName: *; Component Link: *; ComponentWeigt: *; Firme: *; Leadform: *; NN: *; KIND: *
ZQ1 = 50.0-JXS11-8-10-20-T1-FU-LF (50MHz,1.6x1.2mm): ComponentHeigt: 1.8; Firme: Linear; Leadform: формована; Kind: Микросхема; ClassName: *; Component Link: *; Packaging: SOT-223; NN: *